# Altium project Gard_ATMega128-Board_Prj.PrjPcb
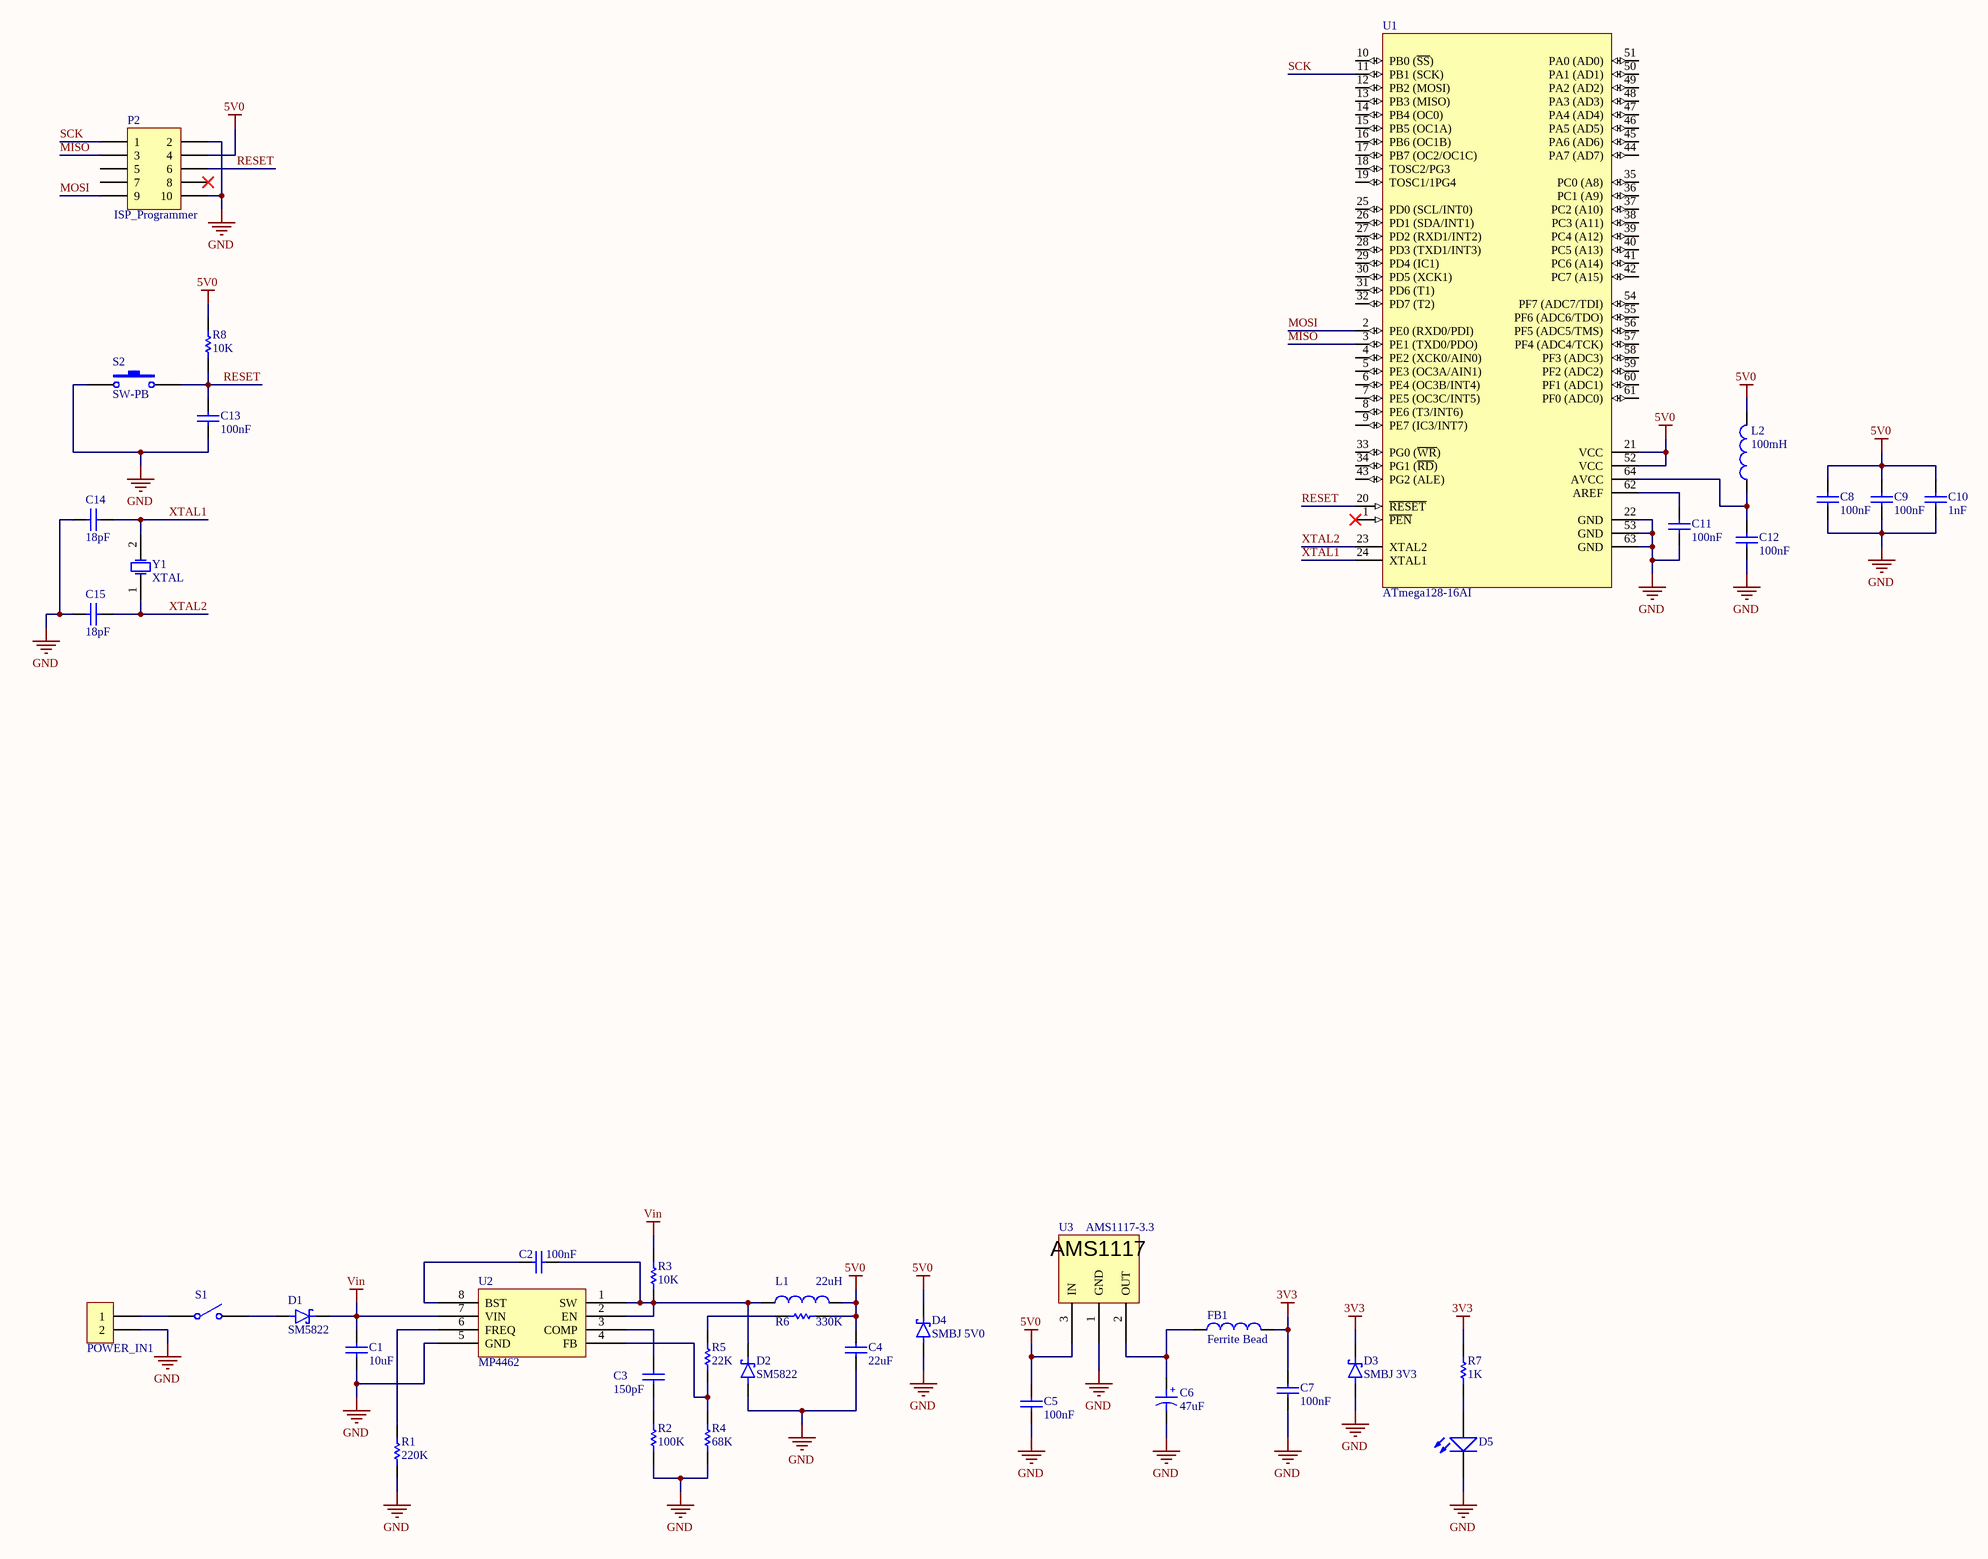
[diagram p0: Gard_ATMega128-Board_SCH.SchDoc]
1 sheet, 39 parts. Net scope: global (net labels, ports and power ports of the same name join across sheets).
Board file: Gard_ATMega128-Board_PCB.PcbDoc

## Sheet Gard_ATMega128-Board_SCH.SchDoc
size A2; SheetNumber: 1; SheetTotal: 2; SPICEModelCacheHCEWSHOH: <root> / <DocumentId>HCEWSHOH</DocumentId> / <CacheFrame Number="0"> / <Model Name="xtal" Kind="CKT"> / <Text>*Generic type:crystal pkg:HC33/51 / .SUBCKT XTAL 1 2 PARAMS: FREQ=1Meg RS=750 C=13pf Q=1000 / LX 1 3 {((Q*RS)/(6.2831852*FREQ))} IC=0.5M / CX 3 4 {(1/(Q*6.2831852*FREQ*RS))} / C0 1 2 {C} / RS 4 2 {RS} / .ENDS XTAL</Text> / </Model> / </CacheFrame> / </root>

### Parts
C1  10uF  [CAP0201]
C2  100nF  [CAP0201]
C3  150pF  [CAP0201]
C4  22uF  [CAP0201]
C5  100nF  [CAP0201]
C6  47uF  [Tan 1206 (3216X18L) Size A]
C7  100nF  [CAP0201]
C8  100nF  [CAP0201]
C9  100nF  [CAP0201]
C10  1nF  [CAP0201]
C11  100nF  [CAP0201]
C12  100nF  [CAP0201]
C13  100nF  [CAP0201]
C14  18pF  [CAP0201]
C15  18pF  [CAP0201]
D1  SM5822  [Diodes SS34]
D2  SM5822  [Diodes SS34]
D3  SMBJ 3V3  [Diodes SS34]
D4  SMBJ 5V0  [Diodes SS34]
D5  LED SMD  [LED_SMD_1206]  (value not drawn)
FB1  Ferrite Bead  [IND0201]
L1  22uH  [IND0201]
L2  100mH  [IND0201]
P2  ISP_Programmer  [HDR2X5]
POWER_IN1  2Pin_Terminal  [2Pin_Terminal]  (value not drawn)
R1  220K  [RES0201]
R2  100K  [RES0201]
R3  10K  [RES0201]
R4  68K  [RES0201]
R5  22K  [RES0201]
R6  330K  [RES0201]
R7  1K  [RES0201]
R8  10K  [RES0201]
S1  SW-SPST  [SPST-2]  (value not drawn)
S2  SW-PB  [SPST-2]
U1  ATmega128-16AI  [64A_N]
U2  MP4462  [SOP_8_NEW]
U3  AMS1117-3.3  [SOT223]
Y1  XTAL  [BCY-W2/D3.1]

### Nets
3V3: C7.2 D3.2 FB1.2 R7.1
5V0: C4.1 C5.2 C8.2 C9.2 C10.2 D4.2 L1.2 L2.2 P2.4 R6.1 R8.1 U1.21(VCC) U1.52(VCC) U3.3(IN)
GND: C1.1 C4.2 C5.1 C6.1 C7.1 C8.1 C9.1 C10.1 C11.1 C12.1 C13.1 C14.2 C15.2 D2.1 D3.1 D4.1 D5.1(K) P2.2 P2.10 POWER_IN1.2 R1.1 R2.1 R4.1 S2.1 U1.22(GND) U1.53(GND) U1.63(GND) U2.5(GND) U3.1(GND)
Vin: C1.2 D1.2 R3.1 U2.7(VIN)
MISO: P2.3 U1.3(PE1_(TXD0/PDO))
MOSI: P2.9 U1.2(PE0_(RXD0/PDI))
RESET: C13.2 P2.6 R8.2 S2.2 U1.20(~{RESET})
SCK: P2.1 U1.11(PB1_(SCK))
XTAL1: C14.1 U1.24(XTAL1) Y1.2(OSC2)
XTAL2: C15.1 U1.23(XTAL2) Y1.1(OSC1)
NetC2_1: C2.1 D2.2 L1.1 R3.2 U2.1(SW) U2.2(EN)
NetC2_2: C2.2 U2.8(BST)
NetC3_1: C3.1 U2.3(COMP)
NetC3_2: C3.2 R2.2
NetC6_2: C6.2 FB1.1 U3.2(OUT)
NetC11_2: C11.2 U1.62(AREF)
NetC12_2: C12.2 L2.1 U1.64(AVCC)
NetD1_1: D1.1 S1.2(NO)
NetD5_2: D5.2(A) R7.2
NetPOWER_IN1_1: POWER_IN1.1 S1.1(COMMON)
NetR1_2: R1.2 U2.6(FREQ)
NetR4_2: R4.2 R5.1 U2.4(FB)
NetR5_2: R5.2 R6.2

Not connected (* = marked no-connect by the designer): P2 5 7 8*; U1 1(~{PEN})* 4(PE2_(XCK0/AIN0)) 5(PE3_(OC3A/AIN1)) 6(PE4_(OC3B/INT4)) 7(PE5_(OC3C/INT5)) 8(PE6_(T3/INT6)) 9(PE7_(IC3/INT7)) 10(PB0_(~{SS})) 12(PB2_(MOSI)) 13(PB3_(MISO)) 14(PB4_(OC0)) 15(PB5_(OC1A)) 16(PB6_(OC1B)) 17(PB7_(OC2/OC1C)) 18(TOSC2/PG3) 19(TOSC1/1PG4) 25(PD0_(SCL/INT0)) 26(PD1_(SDA/INT1)) 27(PD2_(RXD1/INT2)) 28(PD3_(TXD1/INT3)) 29(PD4_(IC1)) 30(PD5_(XCK1)) 31(PD6_(T1)) 32(PD7_(T2)) 33(PG0_(~{WR})) 34(PG1_(~{RD})) 35(PC0_(A8)) 36(PC1_(A9)) 37(PC2_(A10)) 38(PC3_(A11)) 39(PC4_(A12)) 40(PC5_(A13)) 41(PC6_(A14)) 42(PC7_(A15)) 43(PG2_(ALE)) 44(PA7_(AD7)) 45(PA6_(AD6)) 46(PA5_(AD5)) 47(PA4_(AD4)) 48(PA3_(AD3)) 49(PA2_(AD2)) 50(PA1_(AD1)) 51(PA0_(AD0)) 54(PF7_(ADC7/TDI)) 55(PF6_(ADC6/TDO)) 56(PF5_(ADC5/TMS)) 57(PF4_(ADC4/TCK)) 58(PF3_(ADC3)) 59(PF2_(ADC2)) 60(PF1_(ADC1)) 61(PF0_(ADC0))

### Notes on the sheet
- (in symbol Capacitor Tantalum SMD) +

### Library data of the parts
C1-C5 C7-C15 = Capacitor SMD
C6 = Capacitor Tantalum SMD: Value: 100nf
D1-D4 = Diodes SS34
FB1 L1 L2 = INDUCTOR SMD
P2 = Header 5X2: Header, 5-Pin, Dual row; LatestRevisionDate: 17-Jul-2002; LatestRevisionNote: Re-released for DXP Platform.; Publisher: Altium Limited
R1-R8 = Resistor SMD
S1 = SW-SPST: Single-Pole, Single-Throw Switch; Published: 24-Mar-1999; LatestRevisionDate: 17-Jul-2002; LatestRevisionNote: Re-released for DXP Platform.; PackageReference: SPST-2; Publisher: Altium Limited
S2 = SW-PB: Switch; Published: 24-Mar-1999; LatestRevisionDate: 17-Jul-2002; LatestRevisionNote: Re-released for DXP Platform.; PackageReference: SPST-2; Publisher: Altium Limited
U1 = ATmega128-16AI: 8-Bit AVR Microcontroller with 128K Bytes of In-System Programmable Flash Memory; Published: 17-Sep-2003; LatestRevisionDate: 13-Apr-2006; LatestRevisionNote: IPC-7351 Footprint Added.; DatasheetVersion: 2467G-AVR-09/02; PackageVersion: revB, Oct-2001; PackageReference: 64A; Publisher: Altium Limited; PackageDescription: 64-Pin Thin Quad Flat Pack 0.8 mm Pitch; Code_JEDEC: MS-026-AEB; ComponentLink1Description: Manufacturer Link; ComponentLink1URL: http://www.atmel.com; ComponentLink2Description: Datasheet; ComponentLink2URL: http://www.atmel.com/dyn/resources/prod_documents/doc2467.pdf
U3 = AMS1117
Y1 = XTAL: Crystal Oscillator; Published: 8-Jun-2000; LatestRevisionDate: 17-Jul-2002; LatestRevisionNote: Re-released for DXP Platform.; PackageReference: R38; Publisher: Altium Limited